# Altium schematic sheet USBC_CONNECTOR.SchDoc
size A4; SheetNumber: 6; SheetTotal: 6
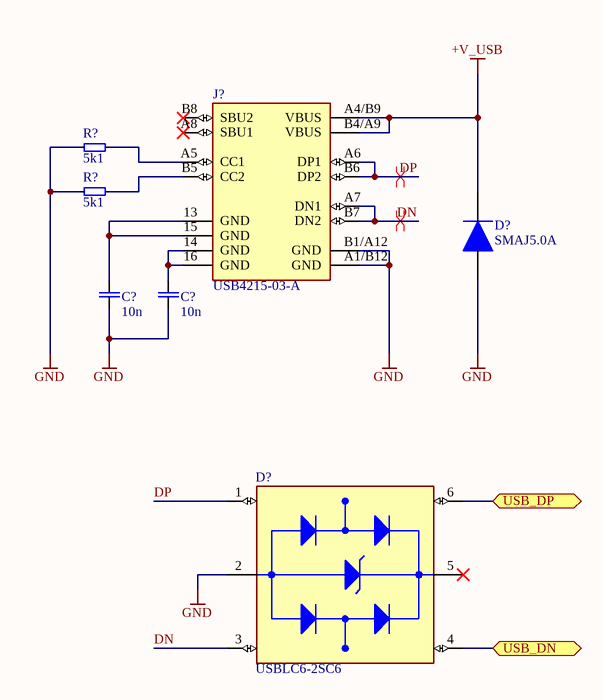
[diagram p0: USBC_CONNECTOR.SchDoc]

## Parts
(Parts that share a designator on the sheet are numbered #1, #2 ... from top to bottom, then left to right.)
C?#1  10n  [C0402]
C?#2  10n  [C0402]
D?#1  SMAJ5.0A  [DIOM5026X229N]
D?#2  USBLC6-2SC6  [SOT95P280X145-6N]
J?  USB4215-03-A  [CONN_8p94X6p5X3p16_12L_GCC]
R?#1  5k1  [R0402]
R?#2  5k1  [R0402]

## Ports
USB_DN (bidir), USB_DP (bidir)

## Nets
+V_USB: D?#1.1(K) J?.A4/B9(VBUS) J?.B4/A9(VBUS)
GND: C?#1.1 C?#2.1 D?#1.2(A) D?#2.2(GND) J?.A1/B12(GND) J?.B1/A12(GND) R?#1.1 R?#2.1
DN: D?#2.3(I/O2_IN) J?.A7(DN1) J?.B7(DN2)
DP: D?#2.1(I/O1_IN) J?.A6(DP1) J?.B6(DP2)
USB_DN: D?#2.4(I/O2_OUT) ; port USB_DN
USB_DP: D?#2.6(I/O1_OUT) ; port USB_DP
NetC?#1_2: C?#1.2 J?.13(GND) J?.15(GND)
NetC?#2_2: C?#2.2 J?.14(GND) J?.16(GND)
NetJ?_A5: J?.A5(CC1) R?#1.2
NetJ?_B5: J?.B5(CC2) R?#2.2

Not connected (* = marked no-connect by the designer): D?#2 5(VBUS)*; J? A8(SBU1)* B8(SBU2)*

## Layout directives
differential pair: DN, DP

## Library data of the parts
C?#1 C?#2 = CMP-00023-15: Generic SMD 0402 Ceramic Capacitor
D?#1 = SMAJ5.0A: BOURNS - SMAJ5.0A - TVS Diode, TRANSZORB SMAJ Series, Unidirectional, 5 V, 9.2 V, DO-214AC (SMA), 2 Pins; Geometry.Height: 2.29mm; Mouser Part Number: 652-SMAJ5.0A; Mouser Price/Stock: https://www.mouser.co.uk/ProductDetail/Bourns/SMAJ5.0A?qs=A3H9pljuJ8RbLIvzFxDfUA%3D%3D; Manufacturer_Name: Bourns; Manufacturer_Part_Number: SMAJ5.0A; Datasheet Link: https://detail.tmall.com/item.htm?id=548354020241&ali_refid=a3_430583_1006:1109983619:N:3Uw9kZ3UMDT/QL57nh1fXA==:ab063b49c94624768a940a913313feb0&ali_trackid=1_ab063b49c94624768a940a913313feb0&spm=a230r.1.14.1
D?#2 = USBLC6-2SC6: 17V Clamp 5A (8/20Âµs) Ipp Tvs Diode Surface Mount SOT-23-6; MF: STMicroelectronics; Value: *; SnapEDA_Link: https://www.snapeda.com/parts/USBLC6-2SC6/STMicroelectronics/view-part/?ref=snap; Check_prices: https://www.snapeda.com/parts/USBLC6-2SC6/STMicroelectronics/view-part/?ref=eda; Purchase-URL: https://pricing.snapeda.com/search/part/USBLC6-2SC6/?ref=eda; Price: None; Availability: In Stock; Package: SOT-23-6 STMicroelectronics; MP: USBLC6-2SC6
J? = USB4215-03-A: Description; Manufacturer_Name: Global Connector Technology; Copyright: Copyright (C) 2026 Ultra Librarian. All rights reserved.; Manufacturer_Part_Number: USB4215-03-A; RefDes: RefDes; Type: Type
R?#1 R?#2 = CMP-00016-11: Generic 0402 SMD Resistor